# EasyEDA Pro project 物流车.epro, board 集成板3.0(省赛)
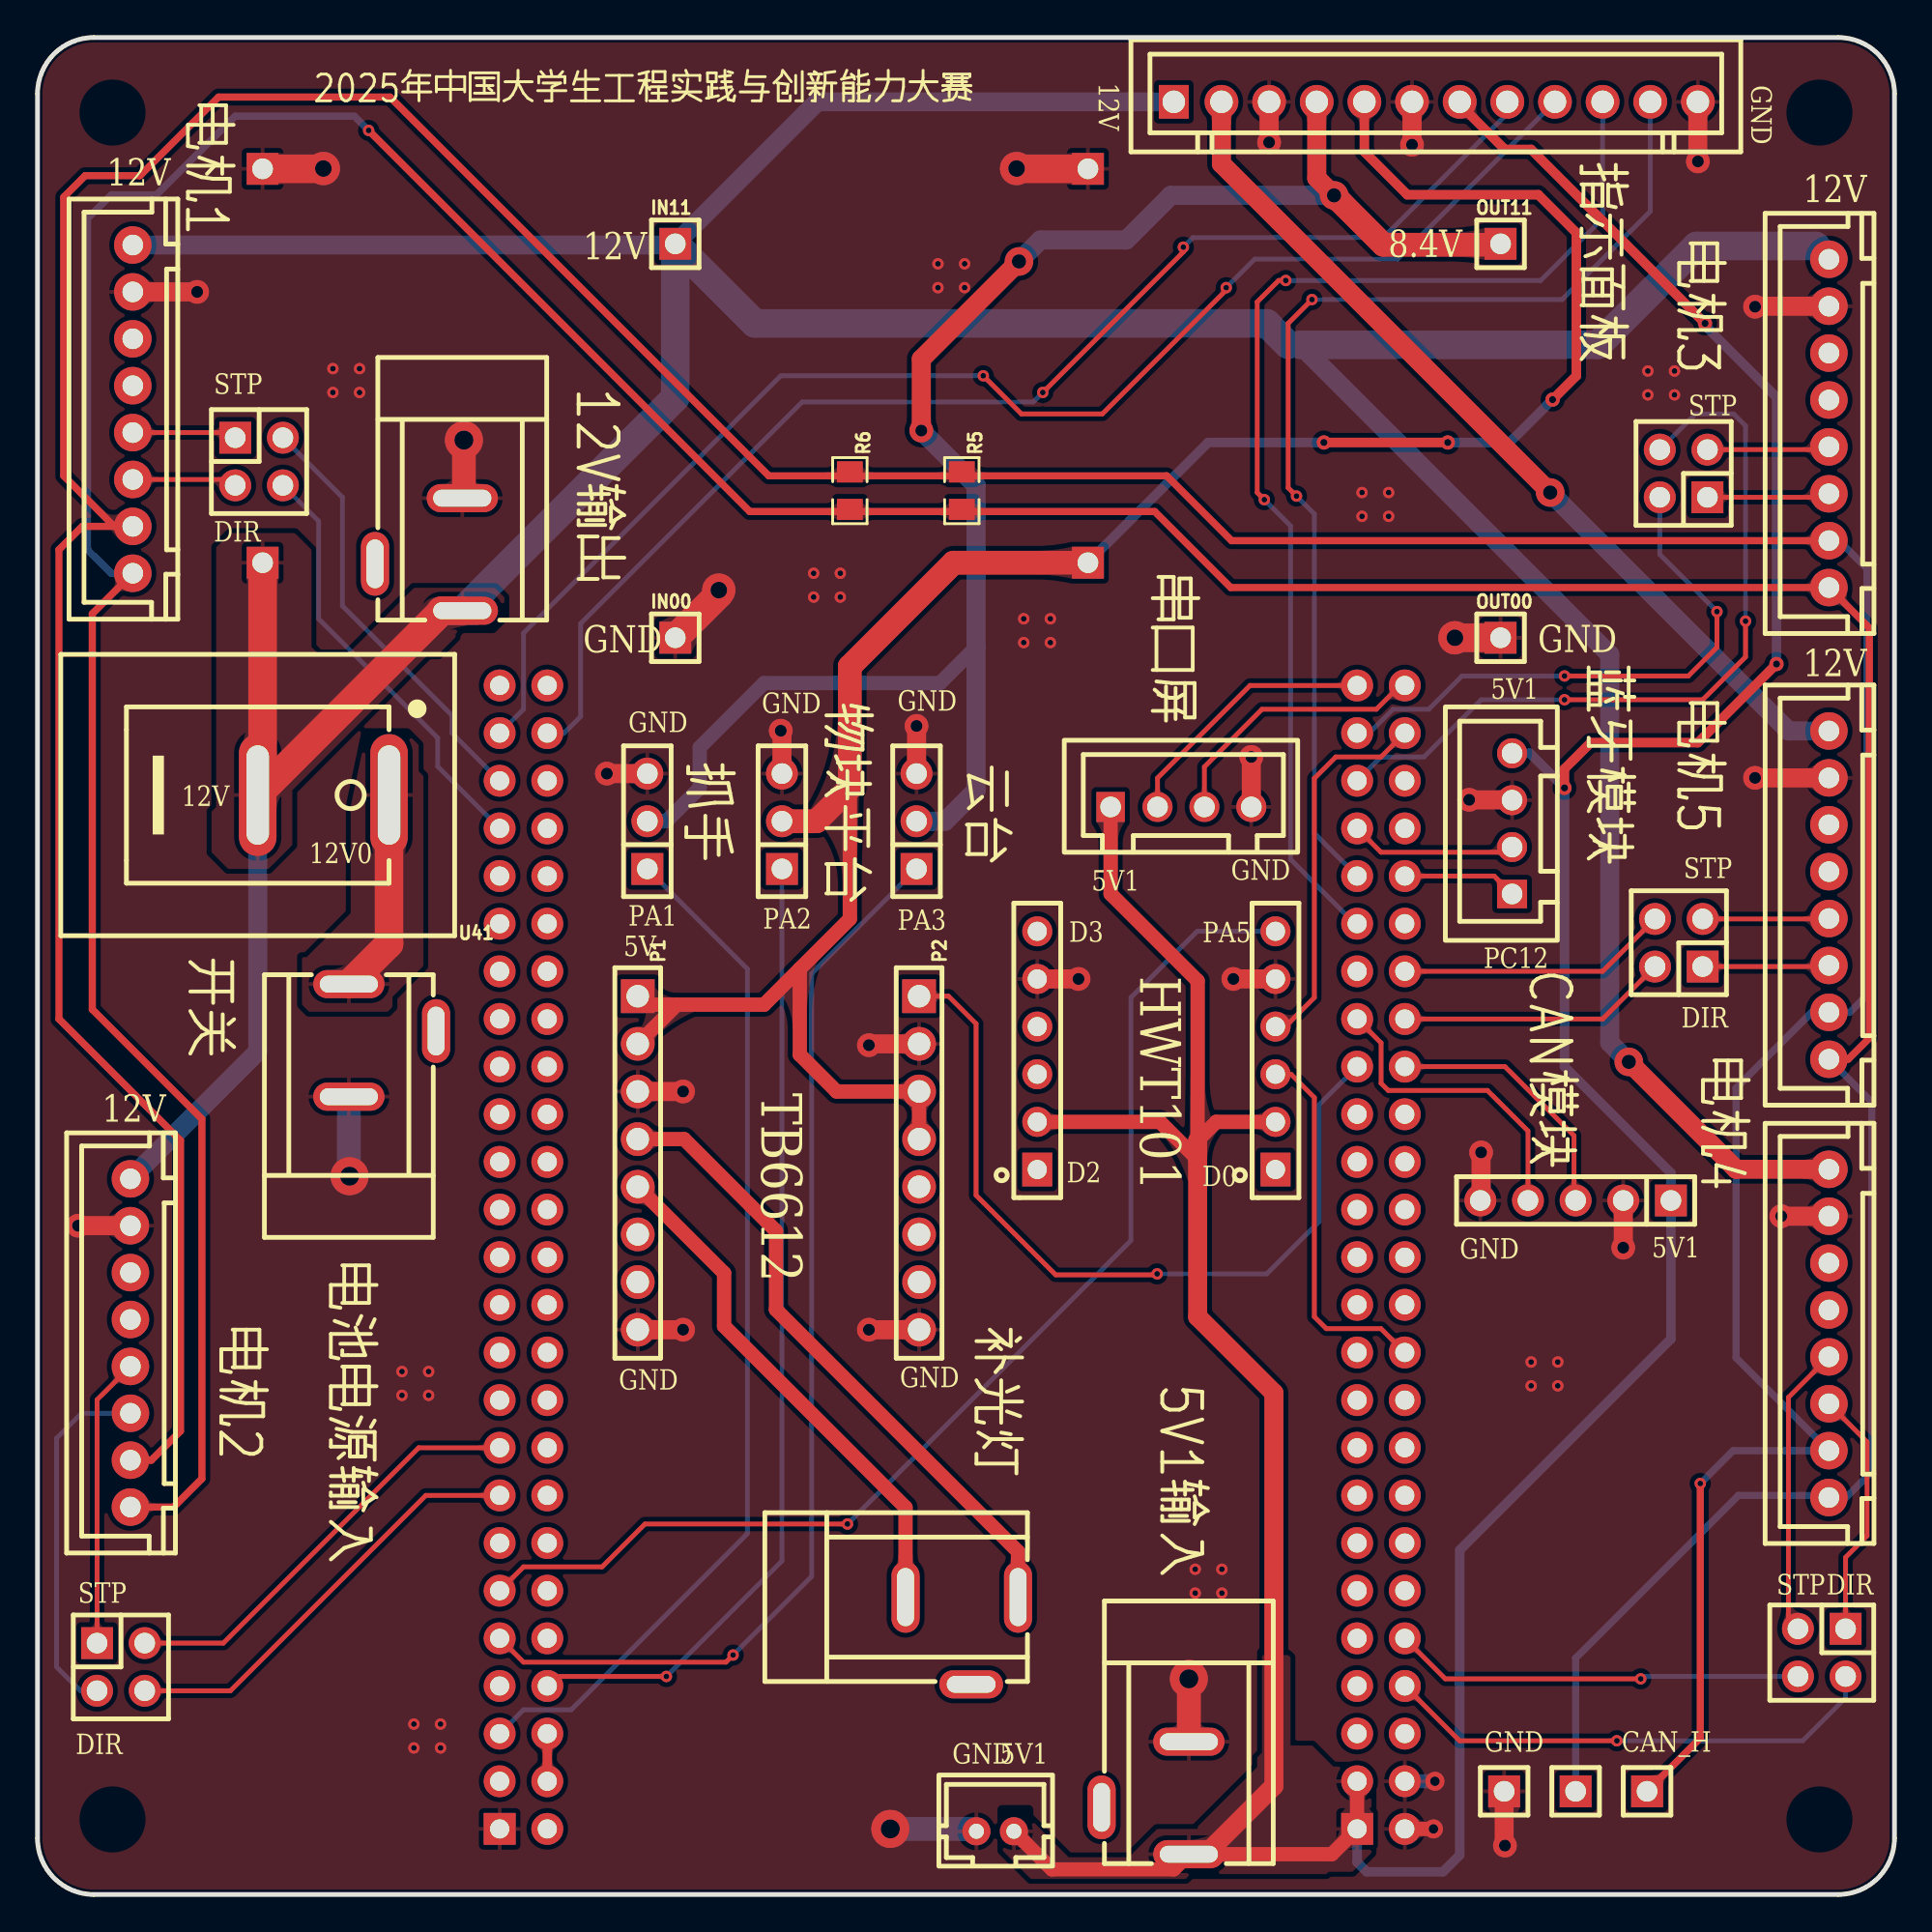
[diagram p13: board, top side]
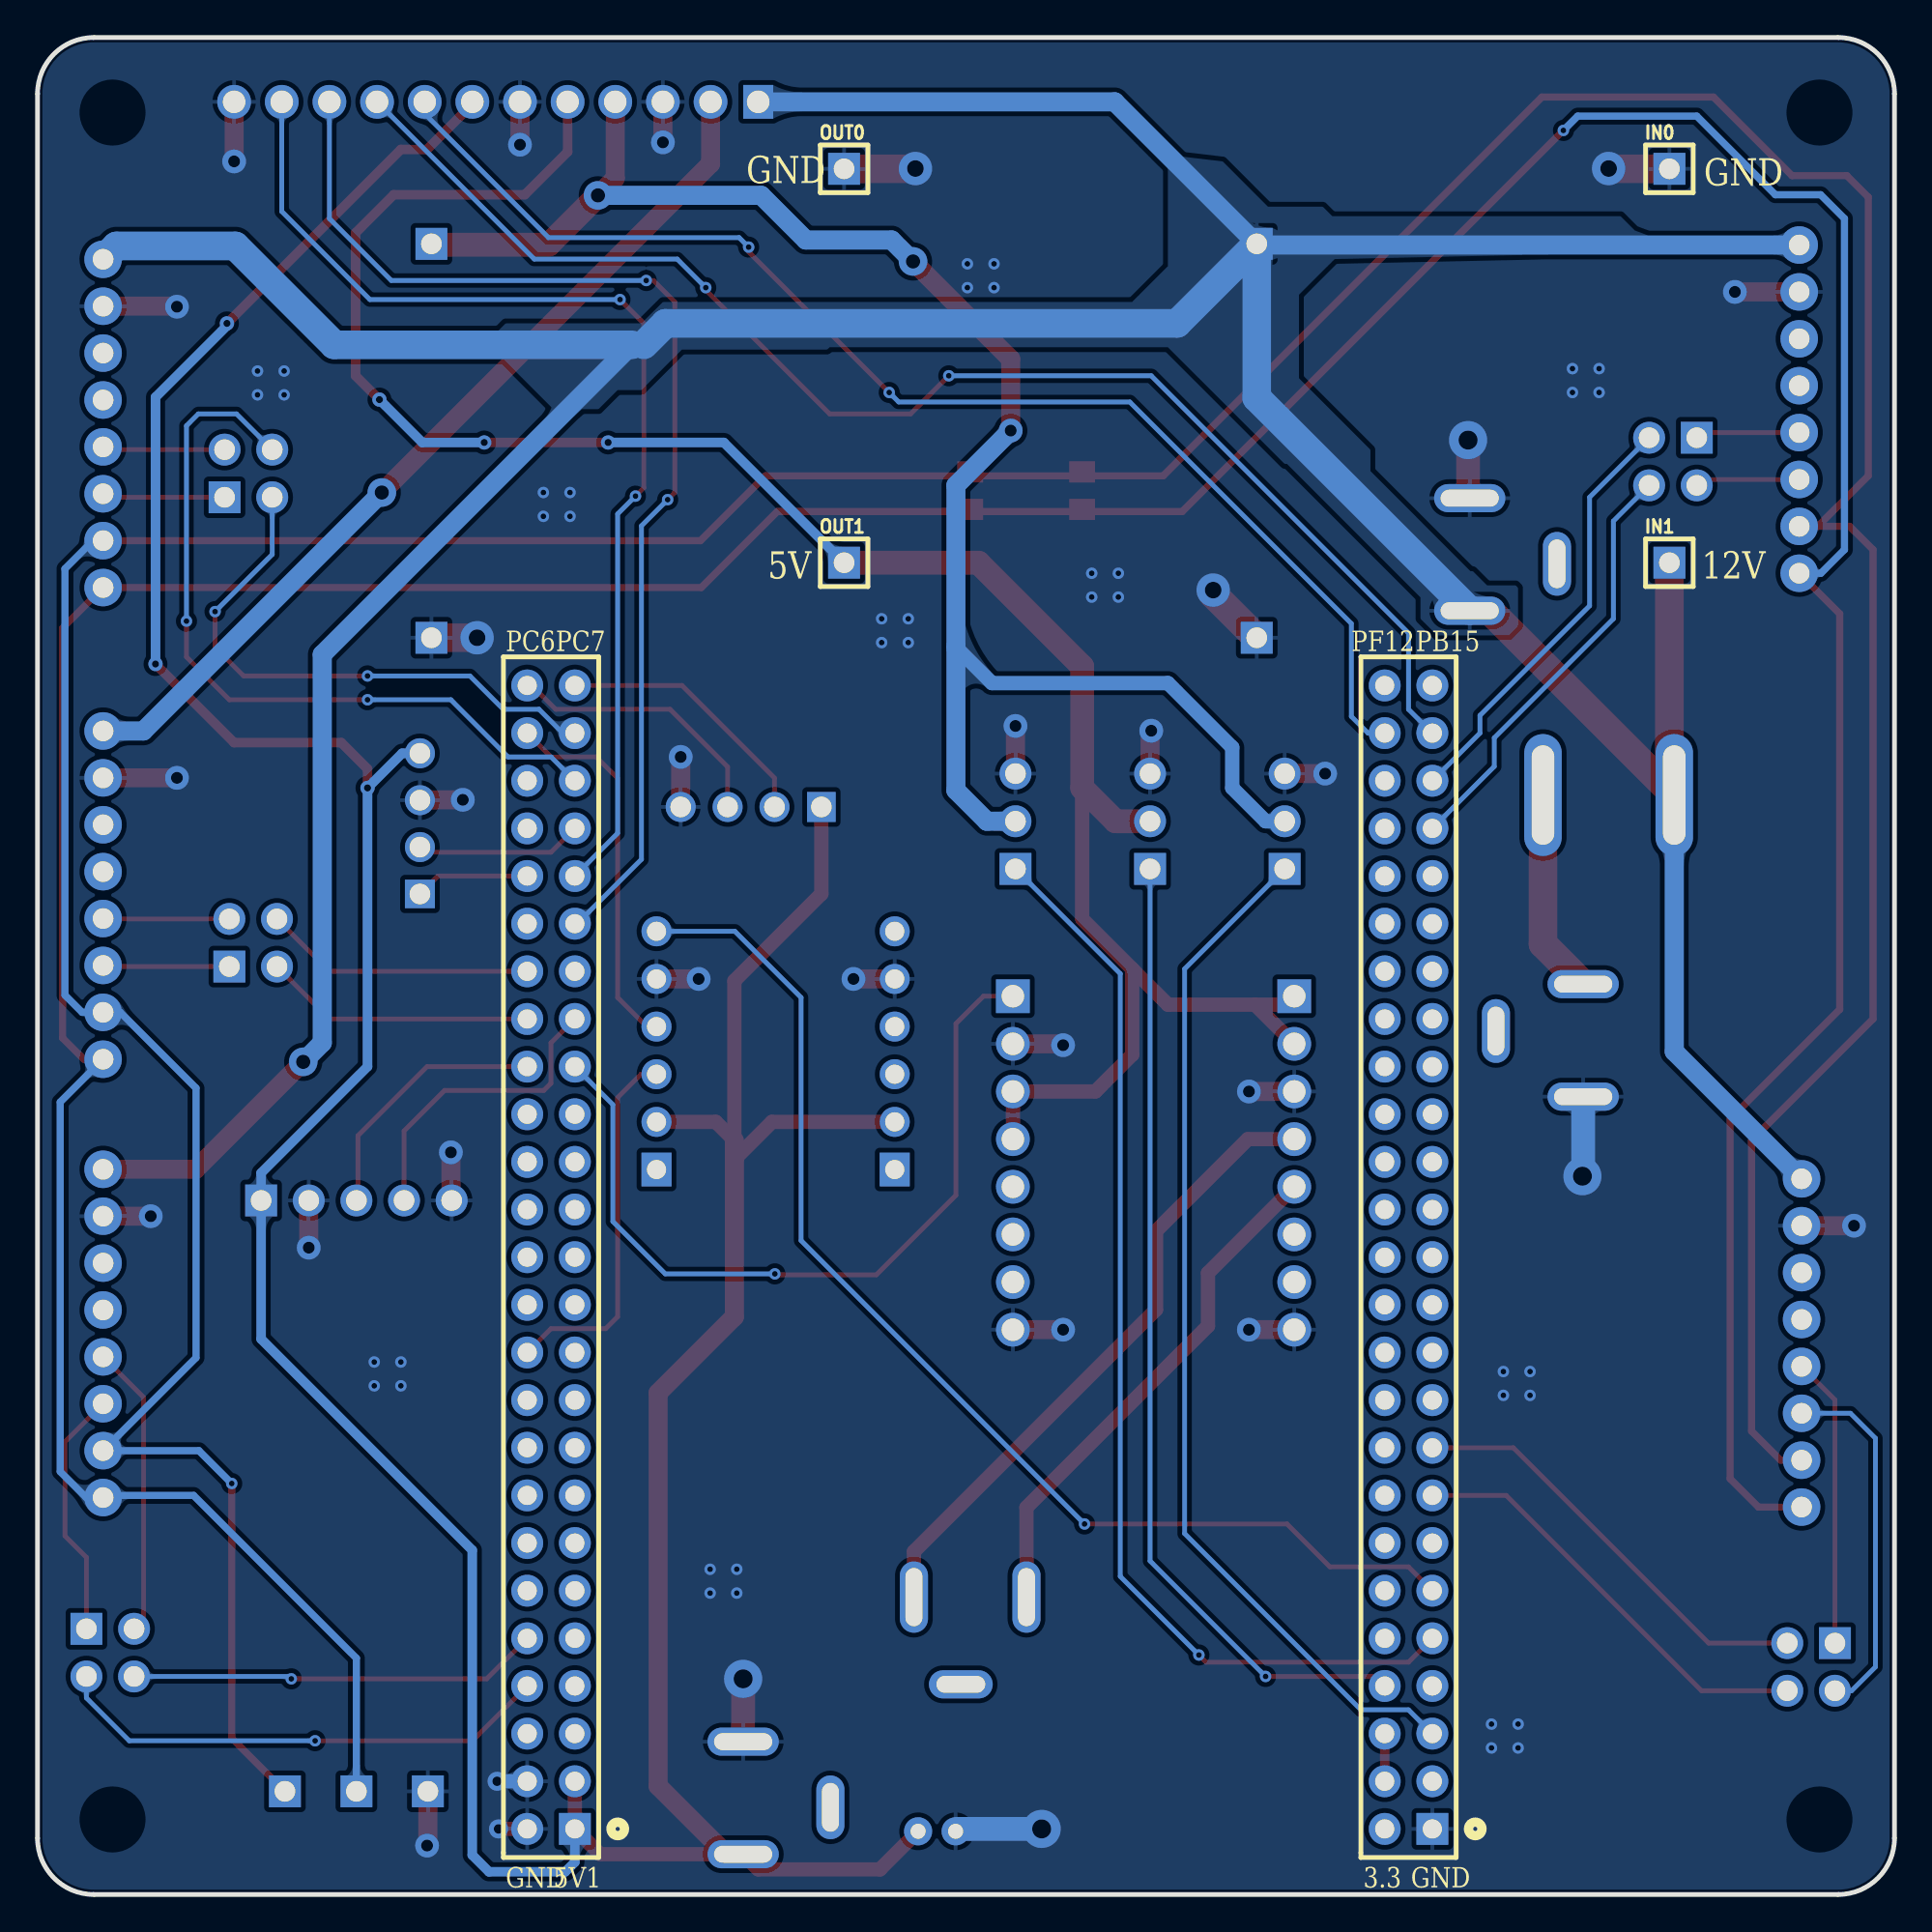
[diagram p14: board, bottom side, seen from below]

Outline 99 x 99 mm; copper layers: Top Layer, Bottom Layer. Coordinates in mm from the lower left corner of the outline.
Outline path: 0,96 0,3 arc(0.88,0.88) 3,0 96,0 arc(98.12,0.88) 99,3 99,96 arc(98.12,98.12) 96,99 3,99 arc(0.88,98.12) 0,96
Stack: Top Layer 0.035mm / Dielectric1 1.51mm FR4 er 4.5 / Bottom Layer 0.035mm

## Design rules (mm)
spacing copperThickness1oz (default): track to track 0.102, other pairs 0.152 to 0.3
spacing copperThickness2oz: track to track 0.203, other pairs 0.152 to 0.3
spacing Plane_innerPlane: track to track 0.102, other pairs 0.152 to 0.3
spacing Copper_copperRegion: track to track 0.102, other pairs 0.152 to 0.3
track width copperThickness1oz (default): min 0.127, default 0.254, max 2.54
track width copperThickness2oz: min 0.203, default 0.254, max 2.54
differential pair differentialPair (default): width min 0.127, default 0.254, max 2.54; gap min 0.152, default 0.152
pour e533 uses Copper_copperRegion
pour e542 uses Copper_copperRegion
pour e554 uses Copper_copperRegion
pour e564 uses Copper_copperRegion
pour e576 uses Copper_copperRegion
pour e699 uses Copper_copperRegion

## Placement (name value [footprint] x y rotation side)
CN8  ZX-XH2.54-4PZZ  [CONN-TH_4P-P2.50_4PIN]  78.61 57.09 90 top
CN12  ZX-XH2.54-4PZZ  [CONN-TH_4P-P2.50_4PIN]  60.96 57.98 0 top
DC2  DC-005-A200  [DC-IN-TH_DC-005-A200]  59.06 5.15 270 top
DC4  DC-005-A200  [DC-IN-TH_DC-005-A200]  49.28 13.53 0 top
DC5  DC-005-A200  [DC-IN-TH_DC-005-A200]  18.92 45.53 90 top
DC6  DC-005-A200  [DC-IN-TH_DC-005-A200]  20.32 71.44 270 top
H1  PZ254V-11-05P  [HDR-TH_5P-P2.54-V-M]  82 37 180 top
H2  PZ254V-11-01P  [HDR-TH_1P-P2.54-V-M]  85.81 5.5 270 top
H3  PZ254V-11-01P  [HDR-TH_1P-P2.54-V-M]  82 5.5 270 top
H4  PZ254V-11-01P  [HDR-TH_1P-P2.54-V-M]  78.19 5.5 270 top
IN00  2.54-1*1P针  [HDR-TH_1P-P2.54-V-M]  34 67 0 top
IN0  2.54-1*1P针  [HDR-TH_1P-P2.54-V-M]  12 92 180 bottom
IN1  2.54-1*1P针  [HDR-TH_1P-P2.54-V-M]  12 71 180 bottom
IN11  2.54-1*1P针  [HDR-TH_1P-P2.54-V-M]  34 88 0 top
M1  PZ254V-12-4P  [HDR-TH_4P-P2.54-V-M-R2-C2-S2.54]  11.81 76.39 270 top
M2  PZ254V-12-4P  [HDR-TH_4P-P2.54-V-M-R2-C2-S2.54]  4.44 12.13 270 top
M3  PZ254V-12-4P  [HDR-TH_4P-P2.54-V-M-R2-C2-S2.54]  87.76 75.76 90 top
M4  PZ254V-12-4P  [HDR-TH_4P-P2.54-V-M-R2-C2-S2.54]  95.12 12.89 180 top
M5  PZ254V-12-4P  [HDR-TH_4P-P2.54-V-M-R2-C2-S2.54]  87.5 50.74 90 top
M11  ZX-XH2.54-8PZZ  [CONN-TH_8P-P2.50-XH2.54-8P]  5.08 79.19 270 top
M22  ZX-XH2.54-8PZZ  [CONN-TH_8P-P2.50-XH2.54-8P]  4.95 29.4 270 top
M33  ZX-XH2.54-8PZZ  [CONN-TH_8P-P2.50-XH2.54-8P]  95.5 78.43 270 top
M44  ZX-XH2.54-8PZZ  [CONN-TH_8P-P2.50-XH2.54-8P]  95.5 29.91 270 top
M55  ZX-XH2.54-8PZZ  [CONN-TH_8P-P2.50-XH2.54-8P]  95.5 53.28 270 top
OUT00  2.54-1*1P针  [HDR-TH_1P-P2.54-V-M]  78 67 0 top
OUT0  2.54-1*1P针  [HDR-TH_1P-P2.54-V-M]  56 92 180 bottom
OUT1  2.54-1*1P针  [HDR-TH_1P-P2.54-V-M]  56 71 180 bottom
OUT11  2.54-1*1P针  [HDR-TH_1P-P2.54-V-M]  78 88 0 top
P1  2.54-1*8P母环保  [HDR-TH_8P-P2.54-V-F-1]  32 39 270 top
P2  2.54-1*8P母环保  [HDR-TH_8P-P2.54-V-F-1]  47 39 270 top
R5  120Ω  [R0805]  49.28 74.84 270 top
R6  120Ω  [R0805]  43.31 74.84 270 top
U2  PM254-1-06-Z-8.5  [hdr-th_6p-p2.54-v-f]  66 45 90 top
U3  PM254-1-06-Z-8.5  [hdr-th_6p-p2.54-v-f]  53.3 45 90 top
U21  ZX-PM2.54-2-25PY  [HDR-TH_50P-P2.54-V-F-R2-C25-S2.54-1]  25.91 33.98 90 bottom
U22  ZX-PM2.54-2-25PY  [HDR-TH_50P-P2.54-V-F-R2-C25-S2.54-1]  71.62 33.98 90 bottom
U23  WAFER-PH2.0-2PZZ  [CONN-TH_2P-P2.00_HC-PH-2A-M]  51.05 3.37 0 top
U36  HB-PH3-25413PB2GOP  [HDR-TH_3P-P2.54-V-M]  32.51 57.22 90 top
U37  HB-PH3-25413PB2GOP  [HDR-TH_3P-P2.54-V-M]  39.69 57.22 90 top
U38  HB-PH3-25413PB2GOP  [HDR-TH_3P-P2.54-V-M]  46.86 57.22 90 top
U41  SS11-RBIWG-R20-R  [sw-th_l21.0-w15.0_ss11-rbiwg-r20-r]  15.24 58.61 180 top
U42  ZX-XH2.54-12PZZ  [CONN-TH_12P-P2.54_ZX-XH2.54-12PZZ]  74.55 95.57 0 top

## Footprints (pads in the part's own frame, mm; a bottom-side part is the same pattern mirrored in y, then rotated)
CONN-TH_2P-P2.00_HC-PH-2A-M
  round 1.5 hole 0.8: 1(-1,0) 2(1,0)
CONN-TH_4P-P2.50_4PIN
  rect 1.524x1.6 hole 1.1: 1(-3.75,0)
  round 1.6 hole 1.1: 2(-1.25,0) 3(1.25,0) 4(3.75,0)
CONN-TH_8P-P2.50-XH2.54-8P
  round 2 hole 1.1: 1(8.75,0) 2(6.25,0) 3(3.75,0) 4(1.25,0) 5(-1.25,0) 6(-3.75,0) 7(-6.25,0) 8(-8.75,0)
CONN-TH_12P-P2.54_ZX-XH2.54-12PZZ
  rect 1.6x1.8 hole 1.2: 1(-13.97,0)
  round 1.8 hole 1.2: 2(-11.43,0) 3(-8.89,0) 4(-6.35,0) 5(-3.81,0) 6(-1.27,0) 7(1.27,0) 8(3.81,0) 9(6.35,0) 10(8.89,0) 11(11.43,0) 12(13.97,0)
DC-IN-TH_DC-005-A200
  oval 1.5x3.8 hole 0.9x3.1: 1(3,2.325) 2(-3,2.325)
  oval 3.4x1.5 hole 2.6x0.9: 3(0.5,-2.325)
HDR-TH_1P-P2.54-V-M
  rect 1.7x1.7 hole 1.1: 1(0,0)
HDR-TH_3P-P2.54-V-M
  rect 1.7x1.7 hole 1.1: 1(-2.54,0)
  round 1.7 hole 1.1: 2(0,0) 3(2.54,0)
HDR-TH_4P-P2.54-V-M-R2-C2-S2.54
  rect 1.7x1.7 hole 1.1: 1(-1.27,-1.27)
  round 1.7 hole 1.1: 2(-1.27,1.27) 3(1.27,-1.27) 4(1.27,1.27)
HDR-TH_5P-P2.54-V-M
  rect 1.7x1.7 hole 1.1: 1(-5.08,0)
  round 1.7 hole 1.1: 2(-2.54,0) 3(0,0) 4(2.54,0) 5(5.08,0)
hdr-th_6p-p2.54-v-f
  rect 1.8x1.6 hole 1.02: 1(-6.35,0)
  round 1.6 hole 1.02: 2(-3.81,0) 3(-1.27,0) 4(1.27,0) 5(3.81,0) 6(6.35,0)
HDR-TH_8P-P2.54-V-F-1
  rect 1.8x1.8 hole 1.2: 1(-8.89,0)
  round 1.8 hole 1.2: 2(-6.35,0) 3(-3.81,0) 4(-1.27,0) 5(1.27,0) 6(3.81,0) 7(6.35,0) 8(8.89,0)
HDR-TH_50P-P2.54-V-F-R2-C25-S2.54-1
  rect 1.7x1.7 hole 1.02: 1(-30.48,-1.27)
  round 1.7 hole 1.02: 2(-30.48,1.27) 3(-27.94,-1.27) 4(-27.94,1.27) 5(-25.4,-1.27) 6(-25.4,1.27) 7(-22.86,-1.27) 8(-22.86,1.27) 9(-20.32,-1.27) 10(-20.32,1.27) 11(-17.78,-1.27) 12(-17.78,1.27) 13(-15.24,-1.27) 14(-15.24,1.27) 15(-12.7,-1.27) 16(-12.7,1.27) 17(-10.16,-1.27) 18(-10.16,1.27) 19(-7.62,-1.27) 20(-7.62,1.27) 21(-5.08,-1.27) 22(-5.08,1.27) 23(-2.54,-1.27) 24(-2.54,1.27) 25(0,-1.27) 26(0,1.27) 27(2.54,-1.27) 28(2.54,1.27) 29(5.08,-1.27) 30(5.08,1.27) 31(7.62,-1.27) 32(7.62,1.27) 33(10.16,-1.27) 34(10.16,1.27) 35(12.7,-1.27) 36(12.7,1.27) 37(15.24,-1.27) 38(15.24,1.27) 39(17.78,-1.27) 40(17.78,1.27) 41(20.32,-1.27) 42(20.32,1.27) 43(22.86,-1.27) 44(22.86,1.27) 45(25.4,-1.27) 46(25.4,1.27) 47(27.94,-1.27) 48(27.94,1.27) 49(30.48,-1.27) 50(30.48,1.27)
R0805
  rect 1.133x1.377 smd: 1(-1,0) 2(1,0)
sw-th_l21.0-w15.0_ss11-rbiwg-r20-r
  oval 2x6.5 hole 1.2x5.3: 1(-3.5,0) 2(3.5,0)

## Nets
5V: OUT1.1 P1.1 P1.2 P2.3 P2.4 U37.2 U42.5
5V1: CN8.4 CN12.1 DC2.1 H1.1 U2.2 U3.2 U22.1 U22.3 U23.2 U42.7
8.4V: OUT11.1 U36.2 U38.2 U42.4
12V: DC6.1 IN1.1 IN11.1 M11.8 M22.8 M33.8 M44.8 U41.2 U42.1
12V0: DC5.1 U41.1
12V5: M55.8 U42.2
GND: CN8.3 CN12.4 DC2.2 DC5.2 DC6.2 H1.2 H1.5 H4.1 IN00.1 IN0.1 M11.7 M22.7 M33.7 M44.7 M55.7 OUT00.1 OUT0.1 P1.3 P1.8 P2.2 P2.8 U2.5 U3.5 U21.1 U22.2 U22.4 U23.1 U36.3 U37.3 U38.3 U42.3 U42.6 U42.12
VBAT: U22.5
VCC3.3: U21.2
VCC3.3VREF: U21.4 U21.6
AO1: DC4.1 P1.4
AO2: DC4.2 P1.5
CAN_H: H2.1 M11.2 M22.2 M33.2 M44.2 M55.2 R5.1 R6.1
CAN_L: H3.1 M11.1 M22.1 M33.1 M44.1 M55.1 R5.2 R6.2
COM1: M11.6
COM2: M22.6
COM3: M33.6
COM4: M44.6
COM5: M55.6
D0: U2.1
D2: U3.1
D3: U3.6
DIR1: M1.3 M11.3
DIR2: M2.3 M22.3
DIR3: M3.1 M33.3
DIR4: M4.1 M44.3
DIR5: M5.1 M55.3
EN1: M11.5
EN2: M22.5
EN3: M33.5
EN4: M44.5
EN5: M55.5
PA1: U21.5 U36.1
PA2: U21.8 U37.1
PA3: U21.9 U38.1
PA4: U21.12
PA5: U2.6 U21.11
PA6: P2.1 U22.33
PA7: U21.14
PA8: U22.41 U42.11
PA11: H1.4 U22.35
PA12: H1.3 U22.34
PA15: U22.27
PB0: M2.4 U21.15
PB1: U21.18
PB2: M2.2 U21.17
PB3: U22.30
PB4: U22.6
PB5: U22.31
PB6: U22.32
PB7: U22.19
PB10: U22.28
PB11: U22.29
PB12: U21.24
PB13: U21.23
PB15: U21.49
PC0: U22.15
PC1: U22.16
PC2: U21.10
PC3: U21.7
PC4: U21.13
PC5: U21.16
PC6: CN12.3 U22.50
PC7: CN12.2 U22.49
PC8: U22.40
PC9: U22.39 U42.10
PC10: M3.4 U22.45
PC11: U22.44
PC12: CN8.1 U22.42
PD0: U22.26
PD1: U22.25
PD2: CN8.2 U22.43
PD3: U22.24
PD4: U22.23
PD5: U2.3 U22.22
PD6: U2.4 U22.48
PD7: M3.2 U22.47
PD8: U21.42
PD9: U21.41
PD10: U21.44
PD11: U21.25
PD12: U21.28
PD13: U21.27
PD14: U21.39
PD15: U21.37
PE0: U22.18
PE1: U22.17
PE2: U22.12
PE3: U22.11
PE5: U22.13
PE6: U22.14
PE7: U21.38
PE8: U21.35
PE9: U21.36
PE10: U21.32
PE11: U21.29
PE12: U21.31
PE13: U21.34
PE14: U21.33
PE15: U21.40
PF0: U21.47 U42.9
PF1: U21.48 U42.8
PF2: M1.2 U21.45
PF3: U21.46
PF4: M1.4 U21.43
PF5: U21.26
PF6: U21.21
PF7: U21.22
PF8: U21.19
PF11: U21.20
PF12: U21.50
PF13: U21.30
PG6: M5.4 U22.38
PG7: U22.37
PG8: M5.2 U22.36
PG9: U22.21
PG10: U22.20
PG11: M4.4 U22.10
PG12: U22.9
PG13: M4.2 U22.8
PG14: U22.7
PG15: U22.46
RESET: U21.3
SCL: U3.3
SDA: U3.4
STP1: M1.1 M11.4
STP2: M2.1 M22.4
STP3: M3.3 M33.4
STP4: M4.3 M44.4
STP5: M5.3 M55.4
VOID1: DC2.3
VOID2: DC4.3
VOID3: DC5.3
VOID4: DC6.3
VOID5: P1.6
VOID6: P1.7
VOID7: P2.5
VOID8: P2.6
VOID9: P2.7

## Via types
v1: diameter 0.61, hole 0.305, Top Layer to Bottom Layer, 60 vias
v2: diameter 1.778, hole 0.889, Top Layer to Bottom Layer, 4 vias
v3: diameter 1.27, hole 0.635, Top Layer to Bottom Layer, 23 vias
v4: diameter 2.032, hole 1.016, Top Layer to Bottom Layer, 4 vias
v5: diameter 1.016, hole 0.508, Top Layer to Bottom Layer, 2 vias
v6: diameter 1.524, hole 0.762, Top Layer to Bottom Layer, 4 vias
v7: diameter 0.762, hole 0.381, Top Layer to Bottom Layer, 6 vias

## Routing (per net, layer and track width the routed paths; a pad name or vN(x,y) marks a point on that pad's centre or on a via; arc(x,y) is an arc through that point)
5V: length 117
  Top Layer w0.508: v7(80.77,79.7) 82.04,80.97 82.04,88.59 80.01,90.62 73.03,90.62 70.74,92.9 U42.5 ; v7(68.58,77.41) v7(75.18,77.41)
  Top Layer w0.762: 34.09,47.44 32.45,47.44 P1.1 ; 34.09,47.44 38.74,47.44 40.64,49.34 ; 34.09,47.44 P1.2 ; 40.64,49.34 40.64,44.77 42.6,42.81 P2.3 P2.4 ; 40.64,49.34 43.31,52.01 43.31,59
  Top Layer w1.27: OUT1.1 48.84,71 43.31,65.47 43.31,59 41.53,57.22 U37.2
  Bottom Layer w0.508: v7(68.58,77.41) 62.41,77.41 OUT1.1 ; v7(75.18,77.41) 78.49,77.41 v7(80.77,79.7)
5V1: length 225.2
  Top Layer w0.508: U42.7 75.82,95.44 78.23,93.03 79.63,93.03 v7(88.9,83.76) ; v7(92.71,65.6) 88.52,61.41 82.8,61.41 81.41,60.01 v7(81.41,59)
  Top Layer w0.762: CN12.1 57.21,53.35 61.85,48.71 61.85,40.2 62.84,41.19 U2.2 ; U3.2 59.84,41.19 61.85,39.18 ; DC2.1 60.57,1.34 54.09,1.34 U23.2 ; U22.3 U22.1 69,2.15 62.28,2.15
  Top Layer w1.016: 61.85,40.2 61.85,30.8 65.91,26.74 65.91,5.78 62.28,2.15 DC2.1
  Bottom Layer w0.508: U22.1 70.35,1.72 70.87,1.21 74.93,1.21 75.82,2.1 75.82,18.36 87.08,29.62 H1.1 87.08,38.46 81.41,44.14 v7(81.41,59) 79.56,60.84 CN8.4 ; v7(92.71,65.6) 92.71,79.82 88.9,83.63 v7(88.9,83.76)
8.4V: length 91.7
  Top Layer w1.016: U42.4 68.2,91.51 v6(69.12,90.58) ; v6(52.32,87.06) 47.12,81.86 v3(47.12,78.05)
  Top Layer w1.27: v6(69.12,90.58) 71.75,87.95 77.95,87.95 OUT11.1
  Bottom Layer w0.762: 50.04,66.51 48.12,64.58 38.74,64.58 35.31,61.15 35.31,59 33.53,57.22 U36.2
  Bottom Layer w1.016: v6(52.32,87.06) 53.47,88.2 58.04,88.2 60.42,90.58 v6(69.12,90.58) ; v3(47.12,78.05) 50.04,75.12 50.04,58.87 48.39,57.22 U38.2
12V: length 258
  Top Layer w1.016: v6(84.84,44.39) 90.56,38.66 M44.8
  Top Layer w1.524: U41.2 12,58.87 ; 12,58.87 IN1.1 ; 12,58.87 21.57,68.44 DC6.1
  Bottom Layer w1.016: M11.8 33.94,87.94 IN11.1 41.57,95.57 U42.1 ; M22.8 11.74,44.94 U41.2 ; 66.68,82.62 67.31,82.62 83.82,66.11 83.82,45.41 v6(84.84,44.39)
  Bottom Layer w1.524: M33.8 94.79,87.89 88.46,87.89 83.19,82.62 67.31,82.62 ; 66.68,82.62 65.53,83.76 38.24,83.76 IN11.1 34,79.8 DC6.1
12V0: length 11
  Top Layer w1.524: DC5.1 18.74,50.68 U41.1
12V5: length 48.2
  Top Layer w1.016: v6(80.65,74.74) 63.12,92.27 U42.2
  Bottom Layer w1.016: M55.8 93.36,62.03 v6(80.65,74.74)
GND: length 90.4
  Top Layer w0.762: U22.2 v5(74.42,3.5)
  Top Layer w1.016: H4.1 78.19,2.65 v3(78.23,2.61) ; U3.5 v3(55.5,48.81) ; M11.7 v3(8.51,85.44) ; P1.8 v3(34.42,30.11) ; M55.7 v3(91.57,59.53) ; U42.12 v3(88.52,92.4) ; U2.5 v3(63.75,48.81) ; CN8.3 78.59,58.36 v3(76.33,58.36) ; U37.3 39.69,61.98 v3(39.62,62.04) ; v3(44.32,45.28) 44.39,45.35 P2.2 ; U42.3 v3(65.66,93.41) ; M22.7 v3(2.16,35.65) ; U42.6 v3(73.28,93.28) ; H1.5 76.96,37.04 v3(76.96,39.56) ; U36.3 v3(30.35,59.76) ; H1.2 v3(84.54,34.48) ; P1.3 v3(34.42,42.81) ; v3(91.57,84.65) 91.59,84.68 M33.7 ; U38.3 v3(46.86,62.3) ; M44.7 v3(92.96,36.16) ; CN12.4 v3(64.71,60.65) ; P2.8 v3(44.32,30.11)
  Top Layer w1.27: DC6.2 22.73,74.53 v4(22.73,77.54) ; DC2.2 v4(61.38,11.5)
  Top Layer w1.524: v2(15.24,92.02) 15.22,92 IN0.1 ; OUT00.1 v2(75.56,67) ; v2(36.32,69.54) 36.32,69.32 IN00.1 ; v2(52.2,92.02) 52.21,92 OUT0.1
  Bottom Layer w0.762: U22.4 v5(74.5,6.04)
  Bottom Layer w1.27: v4(16.64,38.29) 16.6,38.33 DC5.2 ; U23.1 49.93,3.5 v4(45.47,3.5)
  vias: v1(15.75,81.35) v1(15.75,80.08) v1(17.17,81.35) v1(17.17,80.08) v1(19.43,27.88) v1(19.43,26.61) v1(20.07,9.08) v1(20.07,7.81) v1(20.85,27.88) v1(20.85,26.61) v1(21.49,9.08) v1(21.49,7.81) v1(41.38,70.44) v1(41.38,69.17) v1(42.8,70.44) v1(42.8,69.17) v1(48.01,86.94) v1(48.01,85.67) v1(49.43,86.94) v1(49.43,85.67) v1(52.58,68.01) v1(52.58,66.74) v1(54,68.01) v1(54,66.74) v1(61.72,17.34) v1(61.72,16.07) v1(63.14,17.34) v1(63.14,16.07) v1(70.61,74.74) v1(70.61,73.47) v1(72.03,74.74) v1(72.03,73.47) v1(79.63,28.39) v1(79.63,27.12) v1(81.05,28.39) v1(81.05,27.12) v1(85.85,81.22) v1(85.85,79.95) v1(87.27,81.22) v1(87.27,79.95)
VCC3.3VREF: length 2.5
  Top Layer w0.508: U21.6 U21.4
AO1: length 34.3
  Top Layer w0.762: P1.4 34.47,40.27 39.37,35.37 39.37,31.18 52.28,18.28 DC4.1
AO2: length 27.8
  Top Layer w0.762: DC4.2 46.28,20.63 36.6,30.31 36.6,33.13 P1.5
CAN_H: length 263.2
  Top Layer w0.381: H2.1 88.65,8.34 v1(88.65,21.91) ; M33.2 63.65,72.18 60.2,75.63 38.99,75.63 18.8,95.83 9.65,95.83 5.46,91.63 2.54,91.63 1.4,90.49 1.4,75.63 4.09,72.94 ; 4.09,72.94 M11.2 ; 4.09,72.94 2.39,72.94 1.14,71.69 1.14,46.68 7.62,40.2 7.62,24.71 6.07,23.15 M22.2
  Bottom Layer w0.381: M33.2 96.04,72.18 97.54,70.68 97.54,47.95 96.62,47.03 M55.2 94.59,47.03 90.55,42.99 90.55,28.62 M44.2 90.4,23.66 v1(88.65,21.91)
CAN_L: length 259.7
  Top Layer w0.381: M55.1 96.53,44.53 97.66,45.66 97.66,67.52 M33.1 63.61,69.68 59.56,73.73 37.97,73.73 v1(17.65,94.05) ; M11.1 2.92,68.28 2.92,47.18 8.76,41.34 8.76,22.16 7.25,20.65 M22.1
  Bottom Layer w0.381: M11.1 3.92,70.44 2.67,71.69 2.67,89.35 3.94,90.62 6.35,90.62 10.54,94.81 16.89,94.81 v1(17.65,94.05) ; H3.1 82,12.6 90.68,21.28 95.39,21.28 M44.1 96.41,21.16 97.79,22.55 97.79,42.24 M55.1
DIR1: length 5.6
  Top Layer w0.254: M11.3 10.23,75.44 10.54,75.12
DIR2: length 19.4
  Bottom Layer w0.254: M2.3 2.29,10.86 1.02,12.13 1.02,24.32 2.35,25.65 M22.3
DIR3: length 6.6
  Top Layer w0.254: M33.3 95.32,74.49 M3.1
DIR4: length 13.3
  Top Layer w0.254: M4.1 96.39,17.97 97.54,19.12 97.54,24.13 M44.3
DIR5: length 6.8
  Top Layer w0.254: M5.1 95.44,49.47 M55.3
PA1: length 55.3
  Bottom Layer w0.254: U36.1 37.85,49.34 37.85,19.24 28.45,9.85 25.91,9.85 U21.5
PA2: length 52.2
  Top Layer w0.254: U21.8 27.69,11.62 v1(33.53,11.62)
  Bottom Layer w0.254: U37.1 39.69,17.78 v1(33.53,11.62)
PA3: length 59.1
  Top Layer w0.254: U21.9 25.91,12.39 36.7,12.39 v1(37.08,12.77)
  Bottom Layer w0.254: U38.1 41.28,49.09 41.28,16.96 v1(37.08,12.77)
PA5: length 63.5
  Top Layer w0.254: v1(43.18,19.75) 32.38,19.75 30.1,17.47 25.91,17.47 U21.11
  Bottom Layer w0.254: v1(43.18,19.75) 58.29,34.86 58.29,47.82 61.82,51.35 U2.6
PA6: length 43.1
  Top Layer w0.254: P2.1 48.57,47.89 50.04,46.42 50.04,37.28 54.28,33.03 59.64,33.03 v1(59.69,33.09)
  Bottom Layer w0.254: U22.33 68.33,42.11 68.33,35.88 65.53,33.09 v1(59.69,33.09)
PA8: length 58.6
  Top Layer w0.254: v1(67.12,74.55) 66.68,75 66.68,83.76 v1(67.94,85.03)
  Bottom Layer w0.254: U42.11 85.98,89.73 81.28,85.03 v1(67.94,85.03) ; v1(67.12,74.55) 68.07,73.6 68.07,56.58 U22.41
PA11: length 16.5
  Top Layer w0.254: H1.4 79.46,40.7 77.3,42.87 72.01,42.87 71.63,43.25 71.63,45.4 U22.35
PA12: length 14
  Top Layer w0.254: U22.34 78.23,44.14 81.91,40.45 81.91,37.08 H1.3
PB0: length 23.2
  Top Layer w0.254: U21.15 20.7,21.28 10.29,10.86 5.72,10.86
PB2: length 23.2
  Top Layer w0.254: U21.17 20.32,23.82 9.91,13.4 5.72,13.4
PC6: length 14.6
  Top Layer w0.254: CN12.3 62.21,60.12 65.28,63.19 71.37,63.19 72.64,64.46 U22.50
PC7: length 14.2
  Top Layer w0.254: CN12.2 59.71,59.52 64.64,64.46 U22.49
PC9: length 61.9
  Top Layer w0.254: v1(65.41,74.36) 65.02,74.74 65.02,84.9 66.17,86.05 v1(66.55,86.05)
  Bottom Layer w0.254: U22.39 70.23,51.76 66.8,55.19 66.8,72.97 v1(65.41,74.36) ; v1(66.55,86.05) 80.14,86.05 83.44,89.35 U42.10
PC10: length 41.4
  Top Layer w0.254: v1(91.06,67.89) 91.06,65.98 88.77,63.69 v1(81.41,63.69)
  Bottom Layer w0.254: U22.45 71.62,60.65 73.91,60.65 76.96,63.69 v1(81.41,63.69) ; M3.4 88.39,78.93 90.42,78.93 91.06,78.3 v1(91.06,67.89)
PC12: length 6.1
  Top Layer w0.254: CN8.1 77.66,54.3 U22.42
PD2: length 8.9
  Top Layer w0.254: U22.43 71.62,55.57 78.34,55.57 CN8.2
PD5: length 19.9
  Top Layer w0.254: U2.3 66.83,43.73 68.07,42.48 68.07,30.8 68.71,30.17 71.62,30.17 U22.22
PD6: length 20.2
  Top Layer w0.254: U22.48 71.62,60.65 69.22,60.65 68.07,59.5 68.07,47.82 66.52,46.27 U2.4
PD7: length 30.3
  Top Layer w0.254: v1(81.41,64.96) 88.01,64.96 89.53,66.49 v1(89.53,68.39)
  Bottom Layer w0.254: M3.2 86.49,71.44 v1(89.53,68.39) ; v1(81.41,64.96) 75.95,64.96 74.17,63.19 72.26,63.19 70.99,61.92 U22.47
PF0: length 74.3
  Top Layer w0.254: v1(63.37,85.67) 63.37,85.54 56.77,78.93 52.45,78.93 v1(50.42,80.97)
  Bottom Layer w0.254: v1(50.42,80.97) 39.62,80.97 25.91,67.25 25.91,63.19 U21.47 ; U42.9 72.52,87.19 64.9,87.19 v1(63.37,85.67)
PF1: length 68.5
  Top Layer w0.254: v1(53.59,80.08) 61.09,87.57 v1(61.09,87.82)
  Bottom Layer w0.254: v1(61.09,87.82) 61.59,88.33 71.75,88.33 78.36,94.94 U42.8 ; U21.48 28.07,61.92 28.96,62.81 28.96,67.76 40.77,79.57 53.09,79.57 v1(53.59,80.08)
PF2: length 23.1
  Bottom Layer w0.254: M1.2 16.26,74.49 16.26,68.7 22.1,62.86 22.1,61.92 U21.45
PF4: length 23.1
  Bottom Layer w0.254: M1.4 14.99,73.22 14.99,68.01 21.34,61.66 21.34,60.14 U21.43
PG6: length 14.5
  Top Layer w0.254: U22.38 83.44,49.22 M5.4
PG8: length 14.5
  Top Layer w0.254: M5.2 83.44,46.68 U22.36
PG11: length 21.9
  Top Layer w0.254: U22.10 75.05,11.5 v1(85.47,11.5)
  Bottom Layer w0.254: M4.4 85.6,11.62 v1(85.47,11.5)
PG13: length 26.8
  Top Layer w0.254: v1(84.2,8.19) 75.81,8.19 U22.8
  Bottom Layer w0.254: v1(84.2,8.19) 94.11,8.19 96.39,10.48 M4.2
STP1: length 5.6
  Top Layer w0.254: 10.54,77.66 10.27,77.94 M11.4
STP2: length 15.5
  Top Layer w0.254: M22.4 3.17,26.38 M2.1
STP3: length 6.5
  Top Layer w0.254: M33.4 95.36,77.03 M3.3
STP4: length 15.6
  Top Layer w0.254: M44.4 93.34,26.5 93.34,14.67 M4.3
STP5: length 6.7
  Top Layer w0.254: M5.3 95.48,52.01 M55.4

## Copper pours and planes (outline as drawn; the poured copper is in the pictures)
5V1 on Top Layer: 61.47,1.08 68.71,1.08 68.83,1.21 70.1,1.21 71.12,2.23 71.12,6.41 70.71,6.82 69.08,6.82 67.96,7.94 66.8,7.94 66.8,12.64 66.68,12.77 65.41,12.77 65.28,12.89 65.28,7.56 65.02,7.31 65.02,6.8 61.85,3.62 61.85,3.5 59.69,3.5 58.18,1.99 58.18,1.98 54.98,1.98 52.83,4.13 52.83,4.51 51.44,4.51 51.44,2.35 52.96,0.83 61.21,0.83
12V on Top Layer: 10.16,54.68 12.32,54.68 13.59,55.95 13.59,58.87 20.83,66.11 21.37,66.11 22.29,67.03 22.29,67.2 22.59,67.5 24.26,67.5 24.89,68.14 24.89,69.16 24.38,69.66 20.07,69.66 16.52,66.11 15,66.11 14.61,66.51 14.61,71.69 13.72,72.58 10.29,72.58 9.53,71.82 9.53,57.98 9.27,57.72 9.27,55.57
12V on Bottom Layer: 24.38,67.12 25.27,68.01 25.27,69.16 32.38,76.27 32.51,76.27 38.74,82.49 56.77,82.49 56.9,82.36 64.64,82.36 66.8,80.2 68.07,80.2 69.09,79.19 71.5,79.19 74.55,82.24 74.55,83.25 74.04,83.76 66.8,83.76 65.66,84.9 40.64,84.9 38.74,86.81 38.74,92.07 37.97,92.65 35.81,92.4 33.4,89.98 30.48,89.98 29.97,89.47 14.61,89.47 13.84,88.71 12.83,88.33 13.12,87.55 29.84,87.19 31.75,85.28 31.75,80.84 27.94,77.03 27.94,75.89 22.61,70.55 22.48,70.55 21.72,69.79 20.19,69.79 20.07,69.66 20.07,67.63 20.57,67.12
12V0 on Top Layer: 14.48,47.06 18.67,47.06 18.92,47.31 18.92,47.85 20.57,49.5 20.57,59.63 20.32,59.88 20.32,61.28 19.69,61.92 17.52,61.92 16.69,58 16.69,52.32 14.35,49.98 14.1,49.98 14.1,47.44
GND on Top Layer: -4.32,111.57 115.44,111.57 115.44,-11.24 -4.32,-11.24
GND on Bottom Layer: -4.32,111.83 110.49,111.83 110.49,-10.85 -4.32,-10.85

Small or netless copper shapes (teardrops, artwork), in the pictures only: 194 on Top Layer, 93 on Bottom Layer

## Text on the board
Bottom Silkscreen Layer: PB15 | GND | 3.3 | PF12 | PC7 | 5V1 | PC6 | 12V | 5V
Top Silkscreen Layer: DIR | STP | 12V | 12V0 | GND | 5V | PA1 | PA2 | PA3 | 5V1 | D2 | D3 | D0 | PA5 | PC12 | CAN_H | 2025年中国大学生工程实践与创新能力大赛 | 8.4V | 电机1 | 开关 | 电机2 | 电池电源输入 | 12V输出 | 抓手 | TB6612 | 物块平台 | 云台 | 补光灯 | HWT101 | 串口屏 | 5V1输入 | CAN模块 | 指示面板 | 蓝牙模块 | 电机3 | 电机5 | 电机4
